# EasyEDA Pro project car.epro, board PCB1
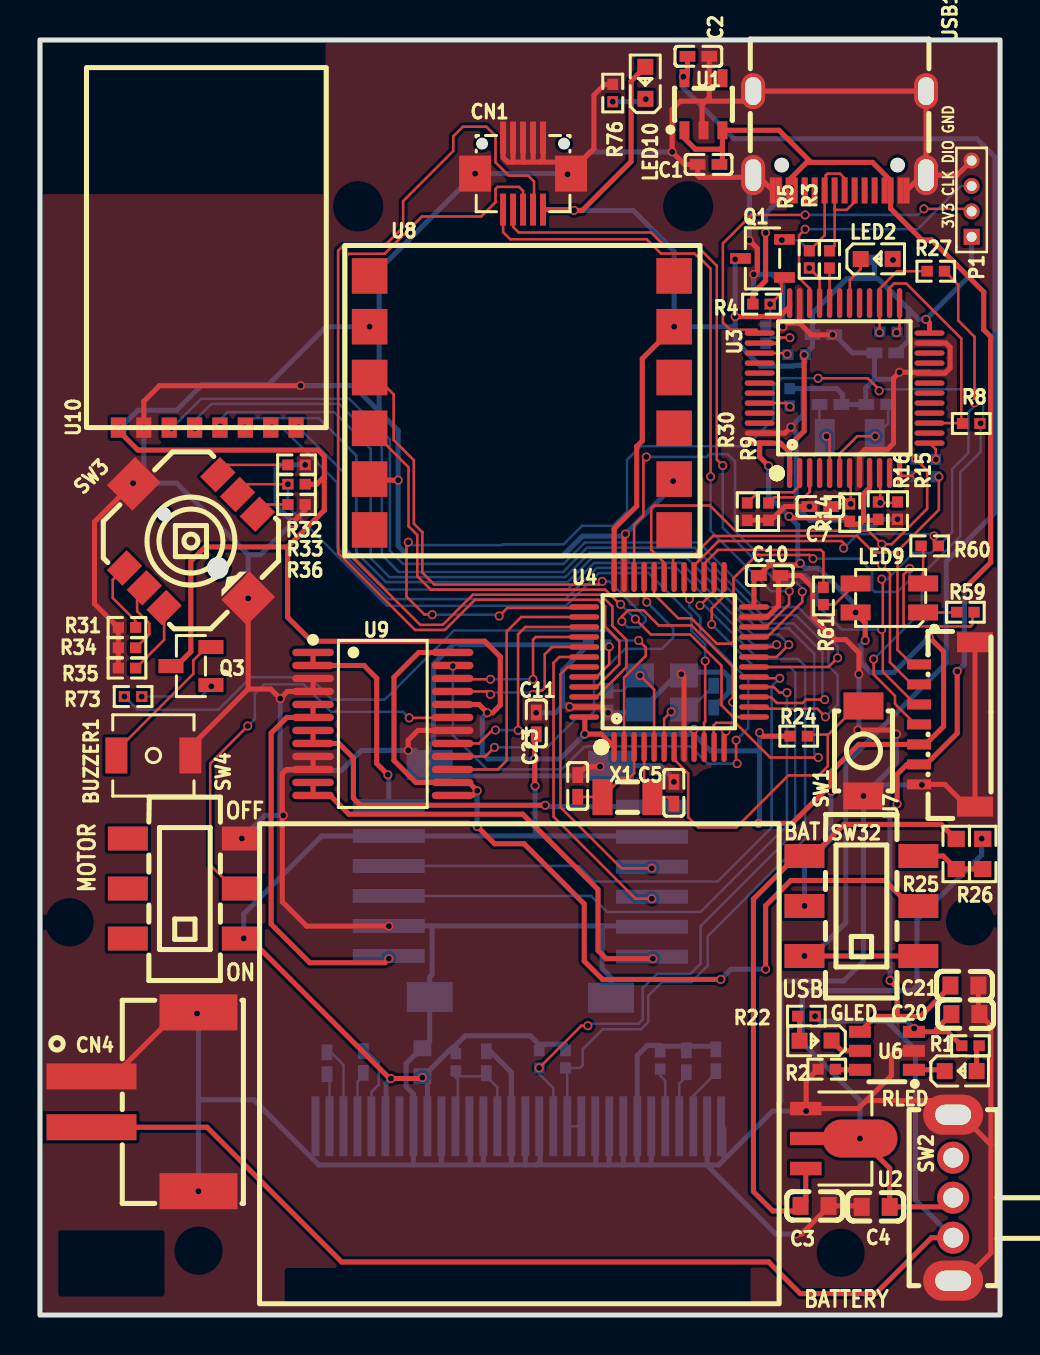
[diagram p1: board, top side]
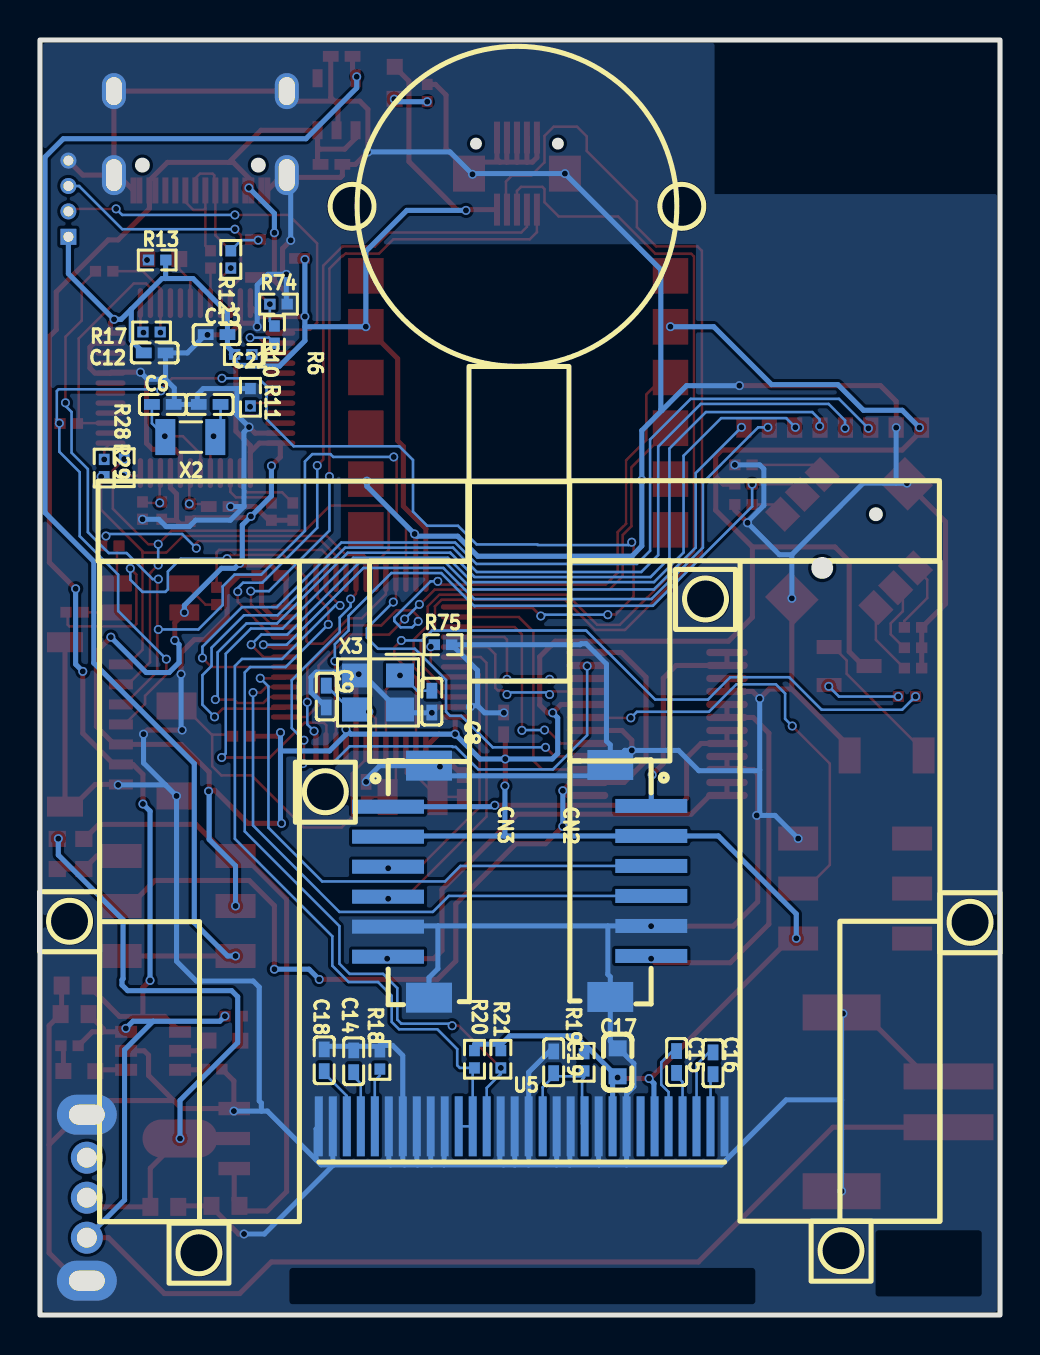
[diagram p2: board, bottom side, seen from below]

Outline 48.04 x 63.75 mm; copper layers: Top Layer, Bottom Layer. Coordinates in mm from the lower left corner of the outline.
Outline path: rectangle 0,63.75 48.04,0
Stack: Top Layer 0.035mm / Dielectric1 1.51mm FR4 er 4.5 / Bottom Layer 0.035mm

## Design rules (mm)
spacing safeClearance (default): track to track 0.127, other pairs 0.127 to 0.127
spacing Copper_copperRegion: track to track 0.152, other pairs 0.152 to 0.3
spacing Plane_innerPlane: track to track 0.152, other pairs 0.152 to 0.3
track width trackWidth (default): min 0.127, default 0.127, max 2.54
differential pair differentialPair (default): width min 0.127, default 0.254, max 2.54; gap min 0.152, default 0.152
net GND uses copperRegion

## Placement (name value [footprint] x y rotation side)
BUZZER1  4kHz  [BUZ-SMD_2P-L4.0-W4.0-L_GSC4317YA]  5.67 27.98 0 top
C1  1uF  [C0402]  33.46 57.53 0 top
C2  1uF  [C0402]  32.95 62.93 180 top
C3  10u  [C0603]  38.76 5.46 180 top
C4  10u  [C0603]  41.82 5.41 0 top
C5  12pF  [C0402]  31.72 26.11 90 top
C6  20pF  [C0402]  41.9 45.53 180 bottom
C7  100nF  [C0402]  39.05 40.42 0 top
C8  20pF  [C0402]  28.43 30.67 90 bottom
C9  20pF  [C0402]  33.72 30.92 90 bottom
C10  100nF  [C0402]  36.52 36.98 180 top
C11  100nF  [C0402]  24.84 29.58 270 top
C12  100nF  [C0402]  42.3 48.11 0 bottom
C13  100nF  [C0402]  39.2 49.02 180 bottom
C14  4.7uf  [C0402]  32.34 12.69 270 bottom
C15  1uf  [C0402]  16.19 12.65 90 bottom
C16  1uf  [C0402]  14.36 12.58 270 bottom
C17  10uf  [C0603_1]  19.14 12.64 270 bottom
C18  2.2uf  [C0402]  33.82 12.74 270 bottom
C19  100nF  [C0402]  22.34 12.64 90 bottom
C20  10uF  [C0603]  46.31 15.05 180 top
C21  10uF  [C0603]  46.26 16.47 180 top
C22  20pF  [C0402]  39.55 45.53 0 bottom
C23  12pF  [C0402]  26.91 26.45 270 top
CN1  X0502FVS-10DS-LPSN  [CONN-SMD_10P-P0.50_X0502FVS-10DS-LPSN]  24.17 57.07 180 top
CN2  A1500WV-S-06PD01  [CONN-SMD_6P-P1.50_A1500WV-S-06PD01]  18.48 21.7 90 bottom
CN3  A1500WV-S-06PD01  [CONN-SMD_6P-P1.50_A1500WV-S-06PD01#2]  29.6 21.67 270 bottom
CN4  2.54-2A-LT  [CONN-SMD_2P-P2.54_XH2.54-2AB]  5.25 10.66 270 top
GLED  ORH-G36G  [LED0603-RD]  38.81 13.72 180 top
LED2  NCD0603Y1  [LED0603-RD]  41.87 52.8 0 top
LED9  LED-RGB-3528  [LED 3528-4PIN]  42.5 35.85 0 top
LED10  -  [LED0603-RD]  30.29 61.61 90 top
P1  -  [1.27-4P烧录孔]  46.62 55.82 90 top
Q1  S8050 J3Y  [SOT-23-3_L3.0-W1.7-P0.95-LS2.9-BR]  36.16 52.83 0 top
Q3  S8550  [SOT-23-3_L2.9-W1.3-P1.90-LS2.4-BR]  7.55 32.45 0 top
R1  1K  [R0402]  46.56 13.46 180 top
R2  1.5K  [R0402]  39.37 12.29 0 top
R3  10Ω  [R0402]  39.51 52.78 270 top
R4  10kΩ  [R0402]  36.11 50.54 180 top
R5  10Ω  [R0402]  38.49 52.78 270 top
R6  100Ω  [R0402]  36.31 49.02 270 bottom
R8  0R  [R0402]  46.6 44.57 180 top
R9  10kΩ  [R0402]  36.46 40.17 270 top
R10  4.7kΩ  [R0402]  37.87 48.03 0 bottom
R11  10kΩ  [R0402]  37.51 45.89 270 bottom
R12  1.5kΩ  [R0402]  38.49 52.78 90 bottom
R13  1kΩ  [R0402]  42.18 52.75 0 bottom
R14  100kΩ  [R0402]  40.52 40.12 270 top
R15  4.7kΩ  [R0402]  41.95 40.22 270 top
R16  4.7kΩ  [R0402]  42.91 40.22 90 top
R17  100Ω  [R0402]  42.46 49.15 180 bottom
R18  1M  [R0402]  31.03 12.73 270 bottom
R19  5.1k  [R0402]  20.81 12.64 270 bottom
R20  5.1k  [R0402]  26.3 12.79 270 bottom
R21  5.1k  [R0402]  24.98 12.79 270 bottom
R22  1K  [R0402]  38.35 14.94 0 top
R24  10kΩ  [R0402]  37.97 28.94 180 top
R25  0R  [R0603]  45.85 23.05 270 top
R26  0R  [R0603]  47.17 23.05 270 top
R27  0R  [R0402]  44.83 52.19 180 top
R28  0R  [R0402]  43.83 42.37 270 bottom
R29  0R  [R0402]  44.83 42.35 90 bottom
R30  10kΩ  [R0402]  35.39 40.17 270 top
R31  3k  [R0402]  4.35 34.38 0 top
R32  1k  [R0402]  12.84 42.51 180 top
R33  1k  [R0402]  12.84 41.54 0 top
R34  4k  [R0402]  4.35 33.36 0 top
R35  5k  [R0402]  4.35 32.35 0 top
R36  2k  [R0402]  12.84 40.52 180 top
R59  1k  [R0402]  46.31 35.14 180 top
R60  2k  [R0402]  44.52 38.45 180 top
R61  510  [R0402]  39.2 35.95 90 top
R73  1kΩ  [R0402]  4.66 30.92 180 top
R74  36kΩ  [R0402]  36.11 50.54 0 bottom
R75  NC  [R0402]  27.87 33.51 180 bottom
R76  1kΩ  [R0402]  28.66 61.1 270 top
RLED  ORH-G36G  [LED0603-RD]  46.07 12.2 0 top
SW1  -  [SW-SMD_L3.9-W2.9-P4.15-LS5.0]  41.21 28.2 90 top
SW2  SK12D07VG5  [SW-TH_SK12D07VG5-1]  45.7 5.87 90 top
SW3  K1-5202UA-01  [SW-SMD_K1-5202UA-01]  7.55 38.7 45 top
SW4  MST22D18G2  [SW-SMD_MST22D18G2]  7.25 21.32 90 top
SW32  MST22D18G2  [SW-SMD_MST22D18G2]  41.11 20.45 90 top
U1  XC6210B332MR  [SOT-25_L3.0-W1.6-P0.95-LS2.8-BL]  33.2 60.54 0 top
U2  ME6209A33PG  [SOT-89-3_L4.5-W2.5-P1.50-LS4.2-BR]  39.68 8.82 180 top
U3  STM32F103CBT6  [LQFP-48_L7.0-W7.0-P0.50-LS9.0-BL]  40.26 46.35 0 top
U4  -  [LQFP-48_L7.0-W7.0-P0.50-LS9.0-BL]  31.48 32.65 0 top
U5  SSD1306  [1.3OLED-2]  24.32 10.2 0 bottom
U6  TP4059  [SOT-23-6_L2.9-W1.6-P0.95-LS2.8-BR]  42.38 13.21 0 top
U7  WAFER-SH1.0-7PLB  [CONN-SMD_7P-P1.00_HC-1.0-7PLT]  45.39 29.53 90 top
U8  -  [JY901S]  16.5 51.95 0 top
U9  TB6612FNG(O,C,8,EL  [SSOP-24_L8.4-W5.8-P0.65-LS7.8-BL]  17.16 29.55 270 top
U10  -  [nrf24f01贴片模块]  3.93 44.37 90 top
USB1  -  [USB-C_SMD-TYPE-C-31-M-12]  40.02 58.71 180 top
X1  32.768kHz  [FC-135R_L3.2-W1.5]  29.4 25.89 0 top
X2  8MHz  [CRYSTAL-SMD_L3.2-W1.5-FC-135R32.7680KF-A3]  40.52 43.9 180 bottom
X3  8MHz  [CRYSTAL-SMD_4P-L3.2-W2.5-BL]  31.13 31.13 0 bottom

## Footprints (pads in the part's own frame, mm; a bottom-side part is the same pattern mirrored in y, then rotated)
1.3OLED-2
  rect 0.4x3 smd: 1(-10.531,0.762) 2(-9.831,0.763) 3(-9.131,0.762) 4(-8.431,0.762) 5(-7.731,0.762) 6(-7.031,0.762) 7(-6.331,0.762) 8(-5.631,0.762) 9(-4.931,0.762) 10(-4.231,0.762) 11(-3.531,0.762) 12(-2.831,0.762) 13(-2.131,0.762) 14(-1.431,0.762) 15(-0.731,0.762) 16(-0.031,0.762) 17(0.669,0.762) 18(1.369,0.762) 19(2.069,0.763) 20(2.769,0.762) 21(3.469,0.761) 22(4.169,0.762) 23(4.869,0.762) 24(5.569,0.762) 25(6.269,0.763) 26(6.969,0.762) 27(7.669,0.763) 28(8.369,0.762) 29(9.069,0.762) 30(9.769,0.762)
1.27-4P烧录孔
  rect 0.8x0.8 hole 0.5: 1(-1.905,0)
  round 0.8 hole 0.5: 2(-0.635,0) 3(0.635,0) 4(1.905,0)
BUZ-SMD_2P-L4.0-W4.0-L_GSC4317YA
  rect 1.1x1.8 smd: 1(-1.85,0) 2(1.85,0)
C0402
  rect 0.79x0.54 smd: 1(-0.545,0) 2(0.545,0)
C0603
  rect 0.8x0.9 smd: 1(-0.7,0) 2(0.7,0)
C0603_1
  rect 0.8x0.9 smd: 1(-0.7,0) 2(0.7,0)
CONN-SMD_2P-P2.54_XH2.54-2AB
  rect 1.3x4.5 smd: 1(-1.27,-2.675) 2(1.27,-2.675)
  rect 1.8x3.9 smd: 3(-4.47,2.675) 4(4.47,2.675)
CONN-SMD_6P-P1.50_A1500WV-S-06PD01
  rect 0.7x3.6 smd: 1(3.75,-1.025) 2(2.25,-1.025) 3(0.75,-1.025) 4(-0.75,-1.025) 5(-2.25,-1.025) 6(-3.75,-1.025)
  rect 1.5x2.3 smd: 7(-5.8,1.025) 8(5.8,1.025)
CONN-SMD_6P-P1.50_A1500WV-S-06PD01#2
  rect 0.7x3.6 smd: 1(-3.75,-1.025) 2(-2.25,-1.025) 3(-0.75,-1.025) 4(0.75,-1.025) 5(2.25,-1.025) 6(3.75,-1.025)
  rect 1.5x2.3 smd: 7(5.8,1.025) 8(-5.8,1.025)
CONN-SMD_7P-P1.00_HC-1.0-7PLT
  rect 0.5x1.2 smd: 1(-3,1.4) 2(-2,1.4) 3(-1,1.4) 4(0,1.4) 5(1,1.4) 6(2.001,1.4) 7(3.001,1.4)
  rect 1x1.8 smd: 8(4.111,-1.4) 9(-4.111,-1.4)
CONN-SMD_10P-P0.50_X0502FVS-10DS-LPSN
  rect 0.3x1.6 smd: 1(-1,-1.8) 2(-1,1.8) 3(-0.5,-1.8) 4(-0.5,1.8) 5(0,-1.8) 6(0,1.8) 7(0.5,-1.8) 8(0.5,1.8) 9(1,-1.8) 10(1,1.8)
  rect 1.6x1.8 smd: 11(-2.4,0) 12(2.4,0)
CRYSTAL-SMD_4P-L3.2-W2.5-BL
  rect 1.4x1.2 smd: 1(-1.1,-0.85) 2(1.1,-0.85) 3(1.1,0.85) 4(-1.1,0.85)
CRYSTAL-SMD_L3.2-W1.5-FC-135R32.7680KF-A3
  rect 1x1.8 smd: 1(-1.25,0) 2(1.25,0)
FC-135R_L3.2-W1.5
  rect 1.001x1.801 smd: 1(-1.25,0) 2(1.25,0)
JY901S
  rect 1.778x1.778 smd: 1(0,0) 2(0,-2.54) 3(0,-5.08) 4(0,-7.62) 5(0,-10.16) 6(0,-12.7) 7(15.24,-12.7) 8(15.24,-10.16) 9(15.24,-7.62) 10(15.24,-5.08) 11(15.24,-2.54) 12(15.24,0)
LED0603-RD
  rect 0.8x0.8 smd: 1(-0.799,-0.004) 2(0.799,0.004)
LED 3528-4PIN
  custom 1.5x0.8 smd: 1(1.689,-0.725) 2(-1.689,-0.725) 3(-1.689,0.725) 4(1.689,0.725)
LQFP-48_L7.0-W7.0-P0.50-LS9.0-BL
  oval 0.269x1.501 smd: 1(-2.751,-4.25) 2(-2.251,-4.25) 3(-1.75,-4.25) 4(-1.25,-4.25) 5(-0.75,-4.25) 6(-0.249,-4.25) 7(0.249,-4.25) 8(0.75,-4.25) 9(1.25,-4.25) 10(1.75,-4.25) 11(2.251,-4.25) 12(2.751,-4.25) 25(2.751,4.25) 26(2.251,4.25) 27(1.75,4.25) 28(1.25,4.25) 29(0.75,4.25) 30(0.249,4.25) 31(-0.249,4.25) 32(-0.75,4.25) 33(-1.25,4.25) 34(-1.75,4.25) 35(-2.251,4.25) 36(-2.751,4.25)
  oval 1.501x0.269 smd: 13(4.25,-2.751) 14(4.25,-2.251) 15(4.25,-1.75) 16(4.25,-1.25) 17(4.25,-0.75) 18(4.25,-0.249) 19(4.25,0.249) 20(4.25,0.75) 21(4.25,1.25) 22(4.25,1.75) 23(4.25,2.251) 24(4.25,2.751) 37(-4.25,2.751) 38(-4.25,2.251) 39(-4.25,1.75) 40(-4.25,1.25) 41(-4.25,0.75) 42(-4.25,0.249) 43(-4.25,-0.249) 44(-4.25,-0.75) 45(-4.25,-1.25) 46(-4.25,-1.75) 47(-4.25,-2.251) 48(-4.25,-2.751)
nrf24f01贴片模块
  rect 1.016x0.762 smd: 1(0,0) 2(0,-1.27) 3(0,-2.54) 4(0,-3.81) 5(0,-5.08) 6(0,-6.35) 7(0,-7.62) 8(0,-8.89)
R0402
  rect 0.566x0.54 smd: 1(-0.433,0) 2(0.433,0)
R0603
  rect 0.806x0.864 smd: 1(-0.753,0) 2(0.753,0)
SOT-23-3_L2.9-W1.3-P1.90-LS2.4-BR
  rect 1.25x0.7 smd: 1(1,-0.95) 2(1,0.95) 3(-1,0)
SOT-23-3_L3.0-W1.7-P0.95-LS2.9-BR
  rect 1.038x0.532 smd: 1(1.101,-0.95) 2(1.101,0.95) 3(-1.101,0)
SOT-23-6_L2.9-W1.6-P0.95-LS2.8-BR
  rect 1.1x0.6 smd: 1(1.35,-0.95) 2(1.35,0) 3(1.35,0.95) 4(-1.35,0.95) 5(-1.35,0) 6(-1.35,-0.95)
SOT-25_L3.0-W1.6-P0.95-LS2.8-BL
  rect 0.5x0.899 smd: 1(-0.95,-1.3) 2(0,-1.3) 3(0.95,-1.3) 4(0.95,1.3) 5(-0.95,1.3)
SOT-89-3_L4.5-W2.5-P1.50-LS4.2-BR
  rect 1.575x0.672 smd: 1(1.356,-1.5) 3(1.356,1.5)
  custom 5.377x1.9 smd: 2(-1.356,0)
SSOP-24_L8.4-W5.8-P0.65-LS7.8-BL
  oval 0.364x2.082 smd: 1(-3.575,-3.491) 2(-2.925,-3.491) 3(-2.275,-3.491) 4(-1.625,-3.491) 5(-0.975,-3.491) 6(-0.325,-3.491) 7(0.325,-3.491) 8(0.975,-3.491) 9(1.625,-3.491) 10(2.275,-3.491) 11(2.925,-3.491) 12(3.575,-3.491) 13(3.575,3.491) 14(2.925,3.491) 15(2.275,3.491) 16(1.625,3.491) 17(0.975,3.491) 18(0.325,3.491) 19(-0.325,3.491) 20(-0.975,3.491) 21(-1.625,3.491) 22(-2.275,3.491) 23(-2.925,3.491) 24(-3.575,3.491)
SW-SMD_K1-5202UA-01
  rect 1.4x1.1 smd: 1(-3.3,1.4) 2(-3.3,0) 3(-3.3,-1.4) 4(3.3,1.4) 5(3.3,0) 6(3.3,-1.4)
  rect 2x1.8 smd: 7(0,4.05) 8(0,-4.05)
SW-SMD_L3.9-W2.9-P4.15-LS5.0
  rect 1.351x1.999 smd: 1(-2.251,0) 2(2.251,0)
SW-SMD_MST22D18G2
  rect 1.2x2 smd: 1(-2.5,2.85) 2(0,2.85) 3(2.5,2.85) 4(-2.5,-2.85) 5(0,-2.85) 6(2.5,-2.85)
SW-TH_SK12D07VG5-1
  oval 1.6x1.6 hole 1: 1(-2,0) 2(0,0) 3(2,0)
  oval 2x3 hole 1x1.8: 4(4.15,0) 5(-4.15,0)
USB-C_SMD-TYPE-C-31-M-12
  oval 1.2x2 hole 0.8x1.6: 0(-4.325,1.716) 0(4.325,1.716)
  oval 1.2x1.8 hole 0.8x1.4: 0(-4.325,-2.484) 0(4.325,-2.484)
  rect 0.3x1.3 smd: A1(-3.35,2.484) A4(-2.55,2.484) A5(-1.25,2.484) A6(-0.25,2.484) A7(0.25,2.484) A8(1.25,2.484) A9(2.55,2.484) A12(3.35,2.484) B1(3.05,2.484) B4(2.25,2.484) B5(1.75,2.484) B6(0.75,2.484) B7(-0.75,2.484) B8(-1.75,2.484) B9(-2.25,2.484) B12(-3.05,2.484)

## Nets
As in the schematic, except:
GND: BUZZER1.2 C1.1 C2.1 C3.1 C4.1 C5.2 C6.2 C7.1 C8.1 C9.1 C10.1 C11.1 C12.1 C13.1 C14.1 C17.1 C18.1 C19.2 C20.1 C21.1 C22.2 C23.1 CN1.1 CN1.3 CN1.5 CN1.7 CN1.9 CN1.11 CN1.12 CN2.5 CN2.7 CN2.8 CN3.5 CN3.7 CN3.8 CN4.1 CN4.3 CN4.4 P1.4 R2.1 R9.2 R11.1 R16.1 R18.1 R30.2 R31.1 R32.1 R34.1 R35.1 R36.1 R74.1 R75.2 R76.1 SW1.1 SW2.4 SW2.5 SW3.7 SW3.8 SW4.6 U1.2 U2.1 U3.8 U3.20 U3.23 U3.35 U3.47 U4.8 U4.23 U4.35 U4.47 U5.1 U5.8 U5.10 U5.12 U5.13 U5.15 U5.16 U5.17 U5.21 U5.22 U5.23 U5.24 U5.25 U5.29 U5.30 U6.2 U7.1 U7.8 U7.9 U8.5 U8.8 U9.3 U9.4 U9.9 U9.10 U9.18 U10.2 USB1.0 USB1.A1 USB1.A12 USB1.B1 USB1.B12 X3.2 X3.4

Pads without a net: SW2 3; SW4 1 2 3; U1 4; U3 4 11 14 16 17 18 19 21 22 28 29 31 40 41 42 43 45 46; U5 7; U8 1 6 7 9 10 12; USB1 A5 A8 B5 B8

## Via types
v1: diameter 0.45, hole 0.3, Top Layer to Bottom Layer, 178 vias

## Routing (per net, layer and track width the routed paths; a pad name or vN(x,y) marks a point on that pad's centre or on a via; arc(x,y) is an arc through that point)
3V3: length 270.9
  Top Layer w0.254: 41.21,39.73 41.21,41.06 41.51,41.36 U3.9 ; 41.21,39.73 41.89,39.73 41.95,39.79 ; 41.21,39.73 41.03,39.55 40.66,39.55 R14.2 40.34,39.86 37.55,39.86 v1(37.48,39.93) ; U4.48 27.26,29.87 v1(27.26,29.04) 28.09,29.04 U4.1 ; v1(35.95,24.58) 37.64,24.58 39.3,26.24 39.55,26.24 39.58,26.21 ; v1(44.5,33.89) 45.22,33.17 45.22,29.43 44.35,28.56 43.89,28.53 40.96,28.53 39.58,27.14 39.58,26.21 ; U4.36 28.73,39.32 29.86,40.45 29.86,43.43 30.14,43.71 30.14,47.82 v1(31.73,49.41) ; 14.23,41.92 14.23,40.24 12.39,38.4 ; 14.23,41.92 14.23,42.94 13.92,43.25 4.9,43.25 4.03,44.12 v1(4.03,44.37) U10.1 ; 14.23,41.92 13.85,41.54 R33.2 ; U4.9 v1(32.73,29.28) ; v1(36.46,42.46) 36.01,42.9 U3.48 37.06,43.59 37.51,43.14 ; U3.36 37.51,50.43 37.01,49.92 v1(34.78,49.92) ; v1(38.24,48) 38.24,44.19 37.51,43.47 37.51,43.14 ; v1(41.29,33.73) 41.29,34.62 40.85,35.06 ; C11.2 24.76,28.96 v1(24.76,27.8) 24.76,26.47 v1(24.78,26.45) ; U3.24 44.51,49.6 v1(44.34,49.78) ; 12.39,38.4 12.39,34.88 13.59,33.69 22.26,33.69 23.04,32.91 23.04,30.5 22.65,30.11 v1(22.39,30.11) 21.97,30.53 U9.20 ; 12.39,38.4 8.26,38.4 7.55,37.69 7.55,33.17 6.83,32.45 Q3.3 ; 34.8,52.83 34.78,52.81 v1(34.78,52.78) ; CN1.2 26.69,55.27 v1(26.72,55.23) 27.14,55.23 29.58,57.67 29.58,61.7 LED10.2 ; 39.58,26.21 v1(39.6,26.19) ; R24.2 36.19,28.94 v1(36.01,29.12) ; 37.51,43.14 U3.1 ; 35.73,35.4 35.73,36.73 C10.2 36.5,37.5 37.96,37.5 v1(38.05,37.59) ; SW4.4 10.5,18.82 17.5,11.82 v1(17.56,11.82) 19.09,11.82 v1(19.14,11.87)
  Bottom Layer w0.254: 34.78,49.41 v1(34.78,49.92) v1(34.78,52.78) ; 34.78,49.41 v1(31.73,49.41) 31.73,53.18 29.68,55.23 v1(26.72,55.23) ; 34.78,49.41 34.78,48.72 36.06,47.45 37.72,47.45 37.75,47.48 38.11,47.48 38.29,47.66 38.29,47.85 38.47,48.03 ; 41.75,51.82 41.94,51.82 43.47,50.29 ; 41.75,51.82 40.38,51.82 38.66,50.1 C13.2 38.66,48.42 38.37,48.13 ; 41.75,51.82 41.75,52.74 R13.1 ; 26.3,13.54 24.95,13.54 24.53,13.96 21.27,13.96 20.81,13.5 20.81,13.39 20.64,13.39 19.19,11.94 C17.2 v1(19.14,11.87) 19.39,11.62 U5.9 ; 24.79,23.95 24.78,23.96 v1(24.78,26.45) ; 24.79,23.95 CN2.2 14.1,23.95 10.2,20.05 v1(10.2,18.83) ; 24.79,23.95 30.59,23.95 CN3.2 ; v1(39.6,26.19) 39.58,26.16 39.58,23.78 38.26,22.46 v1(38.26,20.45) ; v1(16.5,49.41) 14.33,49.41 11.43,46.52 8.12,46.52 6.83,45.24 4.9,45.24 v1(4.03,44.37) ; v1(22.39,30.11) 22.13,29.86 22.13,28.08 22.41,27.8 v1(24.76,27.8) 26.02,27.8 v1(27.26,29.04) 32.49,29.04 v1(32.73,29.28) 32.73,29.03 33.56,28.2 35.97,28.2 36.01,28.17 ; U5.6 17.32,9.47 17.32,11.58 v1(17.56,11.82) ; P1.1 46.62,52.07 v1(44.34,49.78) 43.98,49.78 43.47,50.29 ; v1(35.95,24.58) 36.01,24.63 36.01,28.17 ; 36.01,28.17 v1(36.01,29.12) ; 43.47,50.29 43.47,48.73 C12.2 ; v1(44.5,33.89) 42.73,32.12 41.58,32.12 41.08,32.62 41.08,33.52 v1(41.29,33.73) ; v1(36.46,42.46) 36.46,40.96 v1(37.48,39.93) 37.92,39.5 37.92,37.72 v1(38.05,37.59) 38.3,37.34 38.96,37.34 40.82,35.48 v1(40.82,35.13)
GND: length 505.3
  Top Layer w0.254: 47.59,8.51 46.08,10.02 SW2.4 44.99,10.72 41.35,10.72 ; 47.59,8.51 47.59,3.1 46.2,1.72 SW2.5 ; 47.59,8.51 47.59,14.47 C20.1 46.96,15.1 C21.1 ; 33.31,60.69 33.49,60.87 C2.1 ; 33.31,60.69 35.19,60.69 USB1.0 USB1.0 USB1.0 ; 33.31,60.69 33.13,60.51 33.13,59.31 U1.2 ; 33.31,60.69 32.04,60.69 31.63,60.29 v1(31.63,58.15) 32.26,57.53 C1.1 32.91,56.98 33,56.88 35.58,56.88 USB1.0 35.9,57 36.67,56.23 ; 24.18,57.64 23.66,57.64 ; 24.18,57.64 24.68,57.64 ; 24.18,57.64 24.17,57.65 CN1.5 ; 23.66,57.64 23.4,57.64 23.17,57.87 CN1.9 ; 23.66,57.64 23.67,57.66 CN1.7 ; U3.8 41.01,43.01 41.29,43.28 42.41,43.28 42.71,43.58 42.71,46.84 v1(43.01,47.14) 44.47,47.14 U3.20 45.29,47.09 45.54,47.35 45.54,48.39 45.34,48.6 U3.23 ; U9.18 18.91,29.23 18.43,28.74 v1(18.43,28.23) ; 41.35,10.72 40.95,10.32 38.34,10.32 ; 41.35,10.72 42.61,11.98 42.61,12.99 42.82,13.21 U6.2 ; v1(40.98,32.04) 40.98,33.11 40.32,33.77 39.81,33.77 38.68,34.9 38.68,36.38 38.08,36.98 37.06,36.98 36.95,36.87 36.95,35.46 36.4,34.9 U4.23 ; v1(17.46,19.44) 13.35,19.44 12.13,20.66 12.13,27.06 12.34,27.28 U9.10 U9.9 ; 25.03,57.64 25.17,57.79 CN1.1 ; 25.03,57.64 26,57.64 CN1.11 ; 25.03,57.64 24.68,57.64 ; SW3.7 v1(4.66,41.59) 2.73,39.66 2.73,35.56 3.91,34.38 R31.1 R34.1 R35.1 ; C11.1 24.83,30.11 v1(24.83,30.11) ; R30.2 R9.2 36.59,39.74 37.27,40.42 v1(38.51,40.42) ; C23.1 27.33,27.42 v1(28.03,27.42) ; 44.1,26.53 U7.1 ; 44.1,26.53 v1(44.13,26.5) ; 44.1,26.53 45.28,26.53 46.39,25.42 U7.9 U7.8 ; CN4.1 3.68,11.93 6.88,15.13 7.91,15.13 ; C4.1 41.07,5.46 C3.1 39.46,5.41 38.1,4.05 v1(37.83,4.05) ; v1(39.66,49.01) 38.59,49.01 38.01,49.59 ; v1(42.86,29.04) 42.66,29.25 v1(40.93,29.25) ; U3.35 38.01,49.59 ; 38.01,49.59 37.35,49.59 v1(37.17,49.41) ; 7.53,27.98 7.53,28.4 10.42,31.3 ; 7.91,15.13 7.93,15.13 ; 7.91,15.13 v1(7.86,15.07) ; v1(31.68,41.69) 31.73,41.74 31.73,41.79 ; USB1.0 44.13,57 43.37,56.23 ; USB1.0 45.89,57 P1.4 ; CN1.11 26.57,57.17 27.72,58.32 27.72,61 28.26,61.53 R76.1 ; CN1.11 26.54,57.03 v1(26.4,57.03) ; v1(28.43,30.11) 28.14,30.4 U4.47 26.52,30.4 v1(26.51,30.41) ; v1(32.09,32.04) 32.23,31.9 U4.8 ; U4.35 29.23,38.99 v1(29.3,39.05) ; 24.68,57.64 24.68,58.86 CN1.3 ; U8.5 16.55,41.74 v1(17.93,41.74) ; v1(12.63,39.61) 13.27,40.25 R36.1 ; R2.1 38.93,12.29 38.34,11.7 38.34,10.32 ; v1(5.2,44.37) 5.2,45.69 5.98,46.47 v1(13.04,46.47) ; 10.42,31.3 v1(10.42,35.83) ; 10.42,31.3 11.55,31.3 v1(12.03,30.82) 12.38,31.18 U9.4 U9.3 ; v1(35.71,52.03) 35.9,52.22 35.9,53.33 v1(35.49,53.73) ; 38.34,10.32 U2.1 ; v1(37.58,44.4) 37.28,44.09 U3.47
  Bottom Layer w0.254: 34.22,7.76 34.22,9.3 U5.30 ; 34.22,7.76 36.66,10.2 36.96,10.2 ; 34.22,7.76 33.97,7.5 33.36,7.5 ; 29.81,7.5 29.89,7.59 U5.24 29.89,12.97 30.4,13.48 31.03,13.48 31.08,13.44 33.82,13.44 ; 29.81,7.5 29.15,7.5 ; 29.81,7.5 30.52,7.5 ; v1(35.49,53.73) 35.49,56.8 USB1.0 ; v1(38.51,40.42) 37.83,40.42 ; 37.83,40.42 37.83,44.14 v1(37.58,44.4) 38.19,45.01 38.19,46.32 ; 37.83,40.42 38.52,39.74 40.25,39.74 40.57,39.43 41.73,39.43 42.09,39.79 v1(42.91,39.79) ; 24.28,7.5 24.29,7.51 U5.16 ; 24.28,7.5 24.85,7.5 ; 24.28,7.5 23.6,7.5 ; 29.15,7.5 28.44,7.5 ; 29.15,7.5 29.19,7.55 U5.23 ; v1(10.1,23.82) 11.26,24.98 v1(12.18,24.98) 12.03,25.13 12.03,27.24 ; 36.96,10.2 v1(38.34,10.2) ; 36.96,10.2 36.96,10.6 37.07,10.71 37.07,16.39 37.37,16.7 40.22,16.7 41.21,17.69 v1(41.21,25.95) 41.76,26.5 ; 19.63,19.45 CN2.5 17.46,19.44 ; 19.63,19.45 28.13,19.45 ; 19.63,19.45 19.63,17.03 19.5,16.91 CN2.7 19.5,13.7 C17.1 19.09,13.34 18.32,12.57 18.32,11.42 18.69,11.05 U5.8 18.69,7.5 ; 30.52,7.5 33.36,7.5 ; 30.52,7.5 30.59,7.58 U5.25 ; 28.53,27.42 CN3.8 31.04,27.47 31.72,26.78 v1(31.72,26.66) ; 28.53,27.42 28.07,26.96 20.04,26.96 CN2.8 ; 28.53,27.42 v1(28.03,27.42) ; 24.85,7.5 27.82,7.5 ; 24.85,7.5 25.03,7.68 25.03,9.39 U5.17 ; 27.82,7.5 27.82,9.41 U5.21 ; 27.82,7.5 28.44,7.5 ; 12.03,27.24 v1(12.03,30.82) ; 12.03,27.24 12.05,27.22 15.07,27.22 16.09,28.23 v1(18.43,28.23) 18.77,28.23 CN2.8 ; 18.69,7.5 20.07,7.5 ; 18.69,7.5 13.95,7.5 10.7,10.76 7.93,10.76 ; 20.07,7.5 21.53,7.5 ; 20.07,7.5 20.09,7.52 U5.10 ; CN3.7 28.57,16.87 28.13,17.31 28.13,19.45 ; 27.43,33.51 26.15,32.23 26.15,30.47 ; 27.43,33.51 21.02,33.51 20.97,33.57 20.71,33.57 19.7,32.55 19.7,28.7 19.5,28.51 CN2.8 ; 27.43,33.51 R75.2 ; v1(31.63,58.15) 27.52,58.15 v1(26.4,57.03) 26.37,57.07 v1(21.77,57.07) 16.97,52.27 16.97,45.29 16.92,45.23 ; 41.76,26.5 v1(44.13,26.5) ; 41.76,26.5 42.86,27.61 v1(42.86,29.04) ; 33.36,7.5 36.81,4.05 v1(37.83,4.05) ; 33.36,7.5 33.39,7.53 U5.29 ; 28.13,19.45 30.59,19.45 CN3.5 ; 38.19,46.32 39.87,46.32 40.17,46.02 40.17,45.6 C22.2 C6.2 41.32,45.56 41.32,46.35 41.76,46.79 ; 38.19,46.32 R11.1 ; v1(26.51,30.41) 26.45,30.47 26.15,30.47 ; 41.76,46.79 C12.1 40.66,48.11 C13.1 ; 41.76,46.79 42.66,46.79 v1(43.01,47.14) ; X3.2 32.16,32.04 v1(32.09,32.04) ; X3.2 31.83,31.98 30.13,30.28 X3.4 29.86,30.11 v1(28.43,30.11) C8.1 ; X3.2 32.39,32.14 34.22,32.14 34.48,31.89 34.48,31.14 C9.1 ; U5.12 21.53,9.39 21.53,7.5 ; 28.44,7.5 28.49,7.56 U5.22 ; 16.92,45.23 15.68,46.47 v1(13.04,46.47) ; 16.92,45.23 17.93,44.22 v1(17.93,41.74) 17.93,38.45 18.42,37.94 26.14,37.94 27.14,38.94 29.18,38.94 v1(29.3,39.05) 31.68,41.44 v1(31.68,41.69) ; 10.42,38.02 6.84,41.59 5.2,41.59 ; 10.42,38.02 11.04,38.02 v1(12.63,39.61) 12.63,39.66 11.82,40.47 11.82,42.3 12.03,42.51 v1(13.27,42.51) ; 10.42,38.02 v1(10.42,35.83) ; v1(37.17,49.41) 37.17,51.5 36.64,52.03 v1(35.71,52.03) 35.71,50.59 R74.1 ; v1(40.98,32.04) 40.98,29.3 v1(40.93,29.25) ; v1(7.86,15.07) 7.93,15.01 7.93,10.76 ; U5.13 22.19,7.5 ; 22.19,7.5 21.53,7.5 ; 22.19,7.5 23.6,7.5 ; 23.6,7.5 23.59,7.52 U5.15 23.59,12.14 22.39,13.34 22.34,13.34 ; v1(7.93,6.19) 7.93,10.76 ; 5.2,41.59 v1(4.66,41.59) ; 5.2,41.59 v1(5.2,44.37) ; v1(24.83,30.11) 25.79,30.11 26.15,30.47
VBAT: length 69
  Top Layer w0.254: R1.2 46.12,13.46 45.42,14.16 44.88,14.16 ; C20.2 44.88,14.32 44.88,14.16 ; 44.88,14.16 U6.3 ; CN4.2 8.36,9.39 15.1,2.65 36.47,2.65 38.05,1.07 41.82,1.07 44.61,3.87 SW2.1
  Bottom Layer w0.254: 42.38,14.69 43.39,14.69 v1(43.74,14.33) ; 42.38,14.69 39.04,14.69 v1(38.78,14.94) ; 42.38,14.69 43.81,13.26 43.81,5.75 SW2.1
VCC_MOTOR: length 46.9
  Top Layer w0.254: v1(34.07,16.78) 28.15,16.78 27.23,17.7 27.23,20.55 24.22,23.56 22.75,23.56 v1(21.88,24.43) ; SW32.5 43.56,20.45 42.28,21.73 37.57,21.73 36.31,20.47 v1(36.31,17.29) ; U9.24 18.95,33.13 17.71,31.89 17.71,27.72 18.81,26.63 U9.14 21.47,26.63 v1(21.88,26.21) 21.64,25.98 U9.13
  Bottom Layer w0.254: v1(34.07,16.78) 34.58,17.29 v1(36.31,17.29) ; v1(21.88,24.43) v1(21.88,26.21)
ADC_KEY: length 34.5
  Top Layer w0.127: v1(12.41,41.54) 10.4,41.54 SW3.5 ; 33.23,28.4 33.23,29.61 33.29,29.67 v1(33.29,32.7)
  Bottom Layer w0.127: 26.3,35.43 27.96,37.1 30.46,37.1 32.6,34.96 32.6,34.23 33.29,33.54 v1(33.29,32.7) ; 26.3,35.46 17.37,35.46 12.41,40.43 v1(12.41,41.54)
BAT_3.3V: length 31.5
  Top Layer w0.254: U2.3 38.32,5.72 C3.2 37.81,5.2 36.67,5.2 35.7,6.17 35.7,20.8 37.86,22.95 SW32.3 38.66,22.95 40.24,24.53 45.09,24.53 45.82,23.81 R25.1
BAT_3.7V: length 30.5
  Top Layer w0.254: SW2.2 45.24,5.41 C4.2 42.52,7.34 v1(41.03,8.82) ; v1(47.12,23.82) 47.16,23.82 R26.1
  Bottom Layer w0.254: v1(41.03,8.82) 41.03,10.73 38.15,13.62 38.15,15.91 38.45,16.22 43.66,16.22 43.94,16.5 43.94,16.75 43.88,16.81 43.88,19.76 47.12,23 v1(47.12,23.82)
BOOT0: length 2.4
  Top Layer w0.127: U4.44 27.85,31.9 28.48,32.54 v1(28.48,33.41)
BUZZER: length 34.7
  Top Layer w0.127: U4.2 29.23,31.87 30.31,32.96 30.31,33.37 v1(29.96,33.73)
  Bottom Layer w0.127: v1(4.23,30.92) 4.24,30.92 4.9,30.26 8.93,30.26 10.55,31.89 13.5,31.89 14.62,30.77 17.26,30.77 20.71,34.23 28.42,34.23 28.92,33.73 v1(29.96,33.73)
CODER_A1: length 30.5
  Top Layer w0.127: U4.16 36.72,31.4 37,31.12 v1(37.38,31.12)
  Bottom Layer w0.127: CN2.4 27.58,20.95 28.38,20.15 33.06,20.15 37.38,24.48 v1(37.38,31.12)
CODER_A2: length 29.5
  Top Layer w0.127: U4.17 35.79,31.84 v1(37.02,31.84)
  Bottom Layer w0.127: v1(37.02,31.84) 36.61,31.43 36.61,24.37 33.92,21.68 27.77,21.68 27,22.45 CN2.3
CODER_B1: length 16.1
  Top Layer w0.127: v1(30.62,20.81) 29.81,20.81 25.7,24.92 25.7,32.61 25.99,32.9 U4.42
  Bottom Layer w0.127: v1(30.62,20.81) 30.62,20.91 CN3.4
CODER_B2: length 13.9
  Top Layer w0.127: U4.43 26.41,32.4 26.05,32.04 26.05,25.39 29.09,22.34 v1(30.62,22.34)
  Bottom Layer w0.127: v1(30.62,22.34) 30.62,22.41 CN3.3
D+: length 5.8
  Top Layer w0.127: R5.1 39.27,53.98 39.27,56.23 39.32,56.28 39.32,56.98 39.41,57.07 40.03,57.07 40.27,56.84 40.27,56.23
D-: length 4.9
  Top Layer w0.127: R3.1 39.77,53.47 39.77,55.32 ; 39.77,55.32 39.83,55.26 40.37,55.26 40.77,55.65 40.77,56.23 ; 39.77,55.32 39.77,56.23
LED_B: length 8.7
  Top Layer w0.127: 33.23,36.9 33.23,37.56 33.93,38.26 39.08,38.26 39.2,38.13 39.2,36.39
LED_G: length 14.4
  Top Layer w0.127: U4.28 32.73,37.48 33.95,38.7 40.12,38.7 40.28,38.53 40.28,38.4 v1(40.22,38.34) ; v1(44.74,38.95) 44.74,38.67 R60.1
  Bottom Layer w0.127: v1(44.74,38.95) 44.64,39.05 40.93,39.05 v1(40.22,38.34)
LED_R: length 27.5
  Top Layer w0.127: v1(43.52,37.33) 43.22,37.02 43.22,34.56 43.34,34.43 46.57,34.43 46.66,34.52 46.66,35.06 R59.1 ; v1(38.68,37.82) 38.49,38 35.87,38 34.71,36.84 34.71,33.69 34.58,33.57 33.87,33.57 32.6,34.84 31.94,34.84 30.73,36.04 U4.32
  Bottom Layer w0.127: v1(43.52,37.33) 43.52,36.77 42.91,36.16 41.77,36.16 41.64,36.28 41.64,37.17 41,37.82 v1(38.68,37.82)
LED_STLINK: length 2.4
  Top Layer w0.127: LED2.1 41.07,52.29 40.53,51.75 40.53,50.61 40.51,50.59
MOTOR_A1: length 8.7
  Top Layer w0.127: 22.54,31.05 22.41,31.18 U9.21 ; U4.41 25.63,33.4 25.26,33.03 25.26,31.36 25.13,31.23 24.88,31.23 v1(24.67,31.03)
  Bottom Layer w0.127: v1(24.67,31.03) 24.57,31.13 22.63,31.13 22.55,31.05 22.54,31.05
  vias: v1(22.54,31.02)
MOTOR_A2: length 8.6
  Top Layer w0.127: U9.22 20.69,31.79 v1(22.54,31.79) ; U4.40 24.81,33.9 24.67,33.77 v1(24.67,31.79)
  Bottom Layer w0.127: v1(24.67,31.79) v1(22.54,31.79)
MOTOR_A_PWM: length 30.2
  Top Layer w0.127: v1(20.66,32.45) 20.66,32.46 U9.23 ; v1(34.83,28.74) 34.83,27.62 v1(34.88,27.57) ; v1(32.5,35.8) 32.23,36.07 U4.29
  Bottom Layer w0.127: v1(32.5,35.8) 32.5,35.42 33.04,34.87 33.04,34.14 35.44,31.74 35.44,29.35 v1(34.83,28.74) ; v1(20.66,32.45) 20.66,28.99 22.38,27.28 26.11,27.28 27.23,28.4 27.39,28.4 27.42,28.43 32.55,28.43 33.41,27.57 v1(34.88,27.57)
MOTOR_B1: length 11.8
  Top Layer w0.127: v1(23.93,29.23) 23.93,34.04 24.29,34.4 U4.39 ; U9.17 21.97,28.58 22.64,29.25 v1(22.79,29.25)
  Bottom Layer w0.127: v1(23.93,29.23) 23.91,29.25 v1(22.79,29.25)
MOTOR_B2: length 18.1
  Top Layer w0.127: U9.16 22.29,27.93 v1(22.74,28.38) ; U4.33 30.23,35.78 v1(30.36,35.65)
  Bottom Layer w0.127: v1(30.36,35.65) 31.68,34.33 31.68,33.87 31.13,33.31 29.28,33.31 27.72,31.75 27.72,30.16 27.52,29.96 26.96,29.96 25.38,28.38 v1(22.74,28.38)
MOTOR_B_PWM: length 13.5
  Top Layer w0.127: U4.38 24.08,34.9 23.35,34.17 23.35,27.72 22.91,27.28 U9.15
MOTOR_OUT_A1: length 10.7
  Top Layer w0.254: v1(17.41,27.01) 16.85,27.57 16.85,31.84 16.21,32.48 U9.2 U9.1
  Bottom Layer w0.254: CN2.1 17.45,26.97 v1(17.41,27.01)
MOTOR_OUT_A2: length 19.5
  Top Layer w0.254: U9.5 U9.6 12.35,29.88 11.57,29.09 11.57,19.54 13.5,17.61 17.26,17.61 v1(17.46,17.82)
  Bottom Layer w0.254: v1(17.46,17.82) 17.46,17.94 CN2.6
MOTOR_OUT_B1: length 20.1
  Top Layer w0.254: v1(25.28,25.49) 16.04,25.49 15.68,25.84 15.68,27.85 14.96,28.58 U9.8 U9.7
  Bottom Layer w0.254: CN3.1 25.35,25.42 v1(25.28,25.49)
MOTOR_OUT_B2: length 22.9
  Top Layer w0.254: v1(30.67,17.82) 28.33,17.82 27.92,18.22 27.92,21.27 24.16,25.04 15.46,25.04 14.52,25.98 U9.12 U9.11
  Bottom Layer w0.254: v1(30.67,17.82) 30.67,17.87 CN3.6
MPU6050B_RX: length 29.3
  Top Layer w0.127: v1(29.06,35.53) 29.02,35.53 28.29,36.27 19.55,36.27 18.88,36.94 18.88,39.01 ; v1(29.79,34.8) 30.57,34.02 32.55,34.02 34.1,32.47 34.1,30.49 34.69,29.9 U4.13 ; 18.44,42.38 18.44,39.44 18.87,39.01 ; U8.4 18.45,42.38
  Bottom Layer w0.127: v1(29.79,34.8) v1(29.06,35.53)
MPU6050B_TX: length 36
  Top Layer w0.127: U4.12 34.23,29.1 v1(34.33,29.2) ; 19.13,39.14 18.71,39.56 18.71,42.74 17.7,43.75 17.7,46.03 16.78,46.95 ; 19.13,39.14 19.13,37.12 19.73,36.52 27.97,36.52 v1(28.13,36.68) ; 19.13,39.14 19.14,39.13 ; v1(34.67,30.64) 34.67,32.41 32.6,34.48 30.96,34.48 30.21,35.23 29.43,35.23 29.12,34.92 v1(29.12,34.68)
  Bottom Layer w0.127: v1(34.67,30.64) 34.67,29.53 v1(34.33,29.2) ; v1(28.13,36.68) 28.5,36.68 30.31,34.87 30.31,34.7 29.99,34.38 29.42,34.38 v1(29.12,34.68)
NRF_CE: length 48.1
  Top Layer w0.127: U4.18 39.46,32.4 v1(39.91,32.85)
  Bottom Layer w0.127: v1(39.91,32.85) 39.91,33.41 37.93,35.39 36.19,35.39 32.96,38.62 27.27,38.62 26.2,37.55 18.17,37.55 17.51,38.21 17.51,43.78 15.48,45.81 8.06,45.81 v1(6.59,44.33)
NRF_CSN: length 49.4
  Top Layer w0.127: U4.14 35.82,30.31 38.9,30.31 v1(39.3,29.91)
  Bottom Layer w0.127: v1(39.3,29.91) 39.91,30.52 39.91,31.99 39.46,32.45 39.46,33.36 37.83,34.99 36.15,34.99 32.77,38.37 27.37,38.37 26.18,37.15 17.95,37.15 17.1,38 17.1,43.42 14.97,45.55 8.58,45.55 7.75,44.73 v1(7.75,44.33)
NRF_IRQ: length 34.3
  Top Layer w0.127: v1(37.47,33.51) 36.86,32.9 U4.19
  Bottom Layer w0.127: 26.38,36.28 17.32,36.28 15.23,38.37 15.23,42.1 v1(12.94,44.39) ; 26.38,36.26 27.73,37.61 32.08,37.61 35.66,34.02 36.97,34.02 v1(37.47,33.51)
NRF_MISO: length 34.1
  Top Layer w0.127: v1(36.86,33.51) 36.75,33.4 U4.20
  Bottom Layer w0.127: v1(36.86,33.51) 35.69,33.51 31.85,37.35 27.86,37.35 26.3,35.8 17.44,35.8 14.87,38.37 14.87,41.62 12.1,44.39 v1(11.62,44.39)
NRF_MOSI: length 49.8
  Top Layer w0.127: U4.11 33.71,28.42 33.71,29.48 33.84,29.61 34.8,29.61 36.54,27.88 v1(38.95,27.88)
  Bottom Layer w0.127: v1(38.95,27.88) 38.75,28.08 38.75,33.06 37.48,34.32 35.9,34.32 32.37,37.86 27.63,37.86 26.41,36.64 17.31,36.64 15.84,38.12 15.84,42.96 13.95,44.84 10.7,44.84 v1(10.24,44.39)
NRF_SCK: length 45.9
  Top Layer w0.127: U4.15 36.57,30.9 36.87,30.6 38.17,30.6 38.34,30.77 v1(39.27,30.77)
  Bottom Layer w0.127: 26.31,36.92 27.49,38.1 27.51,38.1 27.51,38.11 32.64,38.11 36.18,34.58 37.71,34.58 39.15,33.13 39.15,30.89 v1(39.27,30.77) ; v1(9.03,44.44) 9.03,44.78 9.4,45.15 14.72,45.15 16.55,43.32 16.55,37.84 17.49,36.9 26.31,36.9
NRST: length 17.3
  Top Layer w0.127: SW1.2 40.88,30.45 39.42,28.99 ; R24.1 38.48,29.02 39.42,29.02 39.42,27.44 38.96,26.98 37.45,26.98 34.84,24.38 32.95,24.38 32.44,24.89 32.44,27.08 31.73,27.79 U4.7
OLED_SCL: length 38.4
  Top Layer w0.127: v1(27.42,14.46) 27.09,14.46 v1(24.98,12.36) ; v1(33.62,34.53) 33.62,35.33 34.15,35.86 34.15,36.82 U4.25
  Bottom Layer w0.127: U5.18 25.69,11.35 25.01,12.03 24.98,12.03 ; v1(27.42,14.46) 27.52,14.57 29.96,14.57 30.16,14.77 30.16,16.34 30.87,17.06 32.55,17.06 33.06,17.56 33.06,19.44 37.79,24.18 37.79,32.13 37.53,32.4 35.75,32.4 v1(33.62,34.53)
OLED_SDA: length 39.4
  Top Layer w0.127: U4.26 33.73,36.18 v1(33.03,35.48)
  Bottom Layer w0.127: v1(33.03,35.48) 33.25,35.48 35.93,32.8 37.93,32.8 38.29,32.45 38.29,23.81 33.41,18.93 33.41,17.46 32.6,16.65 31.13,16.65 30.44,15.96 30.44,14.65 30.07,14.29 28.15,14.29 27.16,13.3 27.16,12.48 27.03,12.36 26.3,12.36 26.39,12.27 U5.19 27.09,9.43
PA9/TX: length 23.9
  Top Layer w0.127: 42.91,38.12 41.72,38.12 40.89,38.95 33.69,38.95 ; 42.91,38.12 42.91,33.26 43.64,32.53 U7.7 ; 42.91,38.12 42.91,38.19 44.98,40.26 v1(44.98,41.91) ; U4.30 31.73,37.26 ; 31.68,37.26 31.68,37.83 31.84,37.99 32.72,37.99 33.69,38.96
PA10/RX: length 29.8
  Top Layer w0.127: v1(42.13,37.5) 42.53,37.1 42.53,32.64 43.64,31.53 U7.6 ; U4.31 31.23,37.62 30.57,38.28 ; 30.59,38.29 30.59,40.34 30.72,40.47 33.53,40.47 34.79,39.21 41.45,39.21 v1(42.13,38.54) 42.62,38.54 44.4,40.31 44.4,42.23 v1(43.83,42.8)
  Bottom Layer w0.127: v1(42.13,37.5) v1(42.13,38.54)
PA13/SWD: length 50.1
  Top Layer w0.127: U7.5 43.81,30.53 42.18,32.16 42.18,36.74 v1(42.12,36.79) ; v1(46.77,45.61) 46.77,48.91 45.95,49.73 45.95,51.51 45.27,52.19 R27.1 ; v1(30.34,42.9) 30.2,42.76 30.2,39.97 29.73,39.5 U4.34
  Bottom Layer w0.127: v1(42.12,34.28) 40.12,34.28 38.9,35.5 38.9,36.43 38.31,37.02 36.97,37.02 34.78,39.2 34.78,42.67 34.41,43.04 33.51,43.04 33.37,42.9 v1(30.34,42.9) ; v1(46.77,45.61) 46.77,45.46 46.46,45.15 46.46,43.11 45.65,42.3 45.65,39.14 44.6,38.1 43.71,38.1 42.4,36.79 v1(42.12,36.79)
PA14/SWC: length 66.8
  Top Layer w0.127: 27.06,35.35 23.38,35.35 v1(22.98,34.95) ; R8.1 47.05,44.59 v1(47.07,44.59) ; v1(38.94,46.84) 41.43,46.84 42.04,46.23 ; 19.23,35.03 18.34,35.92 18.34,38.63 ; v1(41.72,32.79) 41.72,32.02 42.78,30.96 42.78,30.56 43.81,29.53 U7.4 ; v1(19.63,35.02) 19.62,35.03 19.24,35.03
  Bottom Layer w0.127: v1(38.94,46.84) 37.1,46.84 36.71,46.44 36.71,44.8 35.35,43.44 30.06,43.44 29.38,42.75 29.38,40.17 28.67,39.46 27.12,39.46 26.19,38.53 23.14,38.53 ; v1(41.72,32.79) 44.13,35.21 44.13,37.02 46.05,38.94 46.05,42.14 47.07,43.16 v1(47.07,44.59) ; 22.85,34.93 22.76,35.02 v1(19.63,35.02) ; 47.02,44.58 47.2,44.75 47.2,46.2 47.11,46.29 42.26,46.29 ; v1(18.43,38.64) 18.57,38.5 23.14,38.5
  vias: v1(41.99,46.21)
PB8: length 53.1
  Top Layer w0.127: U4.45 27.85,31.4 28.99,32.55 28.99,33.7 28.28,34.41 28.28,35.43 27.95,35.76 21.77,35.76 20.26,34.25 18.77,34.25 14.92,38.1 14.92,53.21 15.14,53.43 17.21,53.43 18.17,54.39 18.17,55.69 20.68,58.2 20.68,58.93 21.16,59.42 22.34,59.42 22.8,58.96 22.8,57.63 23.46,56.97 24.43,56.97 24.72,56.67 24.72,55.32 CN1.4
PB9: length 48.2
  Top Layer w0.127: U4.46 27.85,30.9 29.35,32.4 29.35,33.76 28.64,34.46 28.64,35.42 28.06,36.01 21.66,36.01 20.16,34.51 19.03,34.51 15.32,38.18 15.32,52.93 15.45,53.06 17.24,53.06 19.11,54.93 22.08,54.93 22.8,55.64 22.8,56.3 22.9,56.41 23.97,56.41 24.17,56.2 CN1.6
PB10: length 34.1
  Top Layer w0.127: v1(38.15,36.17) 38.15,35.66 36.39,33.9 U4.21 ; CN1.8 23.67,54.41 23.96,54.12 30.58,54.12 31.28,53.43 32.9,53.43 33.87,52.46 33.87,42.77 v1(34.17,42.47)
  Bottom Layer w0.127: v1(34.17,42.47) 34.17,39.36 36.92,36.61 37.88,36.61 38.15,36.35 v1(38.15,36.17)
PB11: length 33.4
  Top Layer w0.127: CN1.10 23.17,54.14 23.53,53.79 30.36,53.79 31.07,53.07 32.75,53.07 32.88,52.94 ; v1(37.5,36.19) 37.48,36.18 37.48,35.54 36.35,34.4 U4.22 ; 32.9,52.97 33.56,52.32 v1(33.56,41.92)
  Bottom Layer w0.127: v1(33.56,41.92) 33.56,39.22 36.59,36.19 v1(37.5,36.19)
PC14: length 4.6
  Top Layer w0.127: C23.2 28.13,25.91 X1.1 29.11,26.86 29.5,26.86 29.73,27.09 U4.3
PC15: length 3.9
  Top Layer w0.127: C5.1 31.4,25.89 X1.2 30.65,26.22 30.23,26.64 U4.4
PD0: length 5.6
  Top Layer w0.127: v1(30.03,31.98) 30.73,31.27 U4.5
  Bottom Layer w0.127: 28.64,31.21 29.16,31.21 29.93,31.98 v1(30.03,31.98)
PD1: length 4.6
  Top Layer w0.127: U4.6 31.23,29.81 v1(31.58,30.16)
  Bottom Layer w0.127: C9.2 32.61,30.36 32.31,30.36 X3.3 32.11,30.16 v1(31.58,30.16)
ST_SWCLK: length 19.2
  Top Layer w0.127: v1(38.29,55) 35.6,55 34.17,53.58 34.17,49.62 34.53,49.26 35.85,49.26 U3.37 ; v1(44.23,55.31) 46.49,55.31 P1.2
  Bottom Layer w0.127: v1(38.29,55) 43.93,55 v1(44.23,55.31)
ST_SWDIO: length 13.3
  Top Layer w0.127: v1(38.29,54.29) 37.98,53.99 37.98,51.85 38.51,51.32 U3.34
  Bottom Layer w0.127: v1(38.29,54.29) 43.93,54.29 46.09,56.45 P1.3
STLINK_EXT_RX: length 0.9
  Top Layer w0.127: U3.13 44.83,43.28 v1(44.83,42.78)
STLINK_EXT_SWC: length 11.5
  Top Layer w0.127: U3.26 42.51,51.35 42.74,51.58 43.35,51.58 46.1,48.82 46.1,44.64 46.15,44.6 ; 46.15,44.6 R8.2 ; 46.15,44.6 U3.15
STLINK_EXT_SWD: length 5
  Top Layer w0.127: R27.2 42.89,52.19 42.01,51.31 U3.27 v1(42.01,49.12)
  Bottom Layer w0.127: R17.2 42.02,49.13 v1(42.01,49.12)
STLINK_EXT_TX: length 1
  Top Layer w0.127: 43.01,42.1 43.15,41.96 v1(43.88,41.96)
  Bottom Layer w0.127: R28.2 43.85,41.93 v1(43.88,41.96)
USB_3.3V: length 68.7
  Top Layer w0.254: C2.2 32.4,61.99 U1.5 32.25,61.85 v1(32.19,61.91) ; v1(38.26,17.95) SW32.4
  Bottom Layer w0.254: v1(38.26,17.95) 38.66,17.95 40.32,19.62 40.32,27.57 45.35,32.6 45.35,37.68 47.79,40.12 47.79,57.9 46.87,58.81 34.73,58.81 32.19,61.35 v1(32.19,61.91)
USB_5V: length 75
  Top Layer w0.254: v1(42.53,16.73) 42.89,16.37 42.89,14.93 ; U6.4 41.8,14.93 42.89,14.93 ; C21.2 45.56,16.42 44.06,14.93 42.89,14.93 ; 37.47,56.23 37.47,56.73 38.37,57.63 38.59,57.63 ; 37.47,56.23 37.47,56.23 ; 37.47,56.23 v1(37.59,56.36) ; v1(45.9,32.18) 45.9,29.09 44.34,27.53 U7.2 43.39,27.53 42.89,27.03 v1(42.89,25.55) ; 34.04,58.29 34.15,58.29 34.15,57.68 34,57.53 ; 34.04,58.29 34.15,58.4 U1.3 36.98,59.24 38.59,57.63 ; 34.04,58.29 32.79,58.29 32.25,58.84 U1.1 ; v1(36.31,54.11) 36.31,51.71 35.67,51.08 R4.2 ; v1(46.26,36.31) 47.57,37.63 47.57,48.92 47.23,49.27 47.23,51.15 44.62,53.75 44.13,53.75 42.57,55.32 42.57,56.73 41.66,57.63 38.59,57.63
  Bottom Layer w0.254: v1(42.89,25.55) 42.53,25.19 v1(42.53,16.73) ; v1(36.31,54.11) 36.31,55.08 v1(37.59,56.36) ; v1(45.9,32.18) 46.26,32.54 v1(46.26,36.31)
USB_D+: length 2
  Top Layer w0.127: U3.33 39.01,51.83 v1(38.49,52.35)
USB_D-: length 1.8
  Top Layer w0.127: U3.32 39.51,50.6 R3.2
USB_RENUMN: length 3
  Top Layer w0.127: v1(37.53,48.87) 37.08,48.87 36.78,48.56 36.05,48.56 U3.38
  Bottom Layer w0.127: v1(37.53,48.87) 36.59,48.87 36.31,48.59
$1N12780: length 1.6
  Top Layer w0.127: v1(37.12,53.74) 37.11,53.76 37.11,53.78
  Bottom Layer w0.127: v1(37.12,53.74) 37.97,53.74 38.49,53.22 R12.2
$1N12782: length 2.8
  Top Layer w0.127: v1(36.54,50.54) 36.55,50.54 37.11,51.1 37.11,51.88
  Bottom Layer w0.127: R6.1 36.54,49.68 v1(36.54,50.54)
$1N12786: length 3.6
  Top Layer w0.127: R30.1 35.92,41.13 36.63,41.13 36.64,41.14 37.68,41.14 38.01,41.47 U3.2
$1N12787: length 3.2
  Top Layer w0.127: U3.3 38.51,41.16 38.24,40.88 36.74,40.88 R9.1
$1N12790: length 3.8
  Top Layer w0.127: v1(39.36,43.94) 39.51,43.78 U3.5
  Bottom Layer w0.127: 39,45.53 39,44.29 v1(39.36,43.94) 39.31,43.94 X2.2
$1N12791: length 5
  Top Layer w0.127: v1(41.8,43.94) 40.89,43.94 40.01,43.06 40.01,42.1
  Bottom Layer w0.127: 41.77,43.9 41.8,43.92 v1(41.8,43.94) 42.44,44.59 42.44,45.53
$1N12796: length 2.4
  Top Layer w0.127: R16.2 42.87,40.61 v1(42.05,40.61) 42.05,42.06 U3.10
$1N12798: length 2.4
  Top Layer w0.127: v1(40.57,40.56) 40.57,42.04 40.51,42.1 ; 39.71,40.55 R14.1
$1N12808: length 1.5
  Top Layer w0.127: v1(42.86,49.12) 43.01,49.27 43.01,50.59
$1N12820: length 1.4
  Top Layer w0.127: v1(37.39,48.04) 37.34,48.1 U3.39
$1N12821: length 1.6
  Top Layer w0.127: U3.44 37.35,45.6 v1(37.53,45.41)
  Bottom Layer w0.127: v1(37.53,45.41) 37.53,45.44 R11.2
$1N12835:
  vias: v1(42.69,52.75)
$1N26575: length 1.2
  Top Layer w0.254: U6.6 39.84,12.26 39.81,12.29
$1N26597: length 1.3
  Top Layer w0.254: R1.1 46.87,13.34 RLED.2
$1N26598: length 1.6
  Top Layer w0.254: U6.5 40.12,13.21 GLED.1
$1N26615: length 1.3
  Top Layer w0.254: GLED.2 38.01,14.85 R22.1
$1N26644: length 22.4
  Top Layer w0.127: v1(18.48,29.86) 20.63,29.86 U9.19 ; v1(10.4,29.45) 8.52,27.57 8.52,22.5 9.7,21.32 SW4.5
  Bottom Layer w0.127: v1(10.4,29.45) 10.75,29.81 10.75,31.08 11.21,31.53 13.19,31.53 14.56,30.16 18.17,30.16 v1(18.48,29.86)
$1N26655: length 3.5
  Top Layer w0.254: SW32.6 45.2,22.95 R25.2 R26.2
$1N26693: length 6.8
  Bottom Layer w0.127: U5.14 22.89,11.39 22.34,11.94 20.87,11.94 20.81,11.88 20.91,11.78 20.91,9.56 U5.11
$1N26696: length 3.1
  Bottom Layer w0.127: U5.28 32.69,10.96 33.77,12.04 33.82,12.04
$1N26699: length 2.5
  Bottom Layer w0.127: 14.36,11.88 14.49,11.76 U5.2
$1N26700: length 4.2
  Bottom Layer w0.127: 14.36,13.28 14.41,13.28 15.19,12.51 U5.3
$1N26701: length 2.6
  Bottom Layer w0.127: U5.4 15.89,11.65 16.19,11.95
$1N26702: length 4.4
  Bottom Layer w0.127: 16.19,13.35 16.23,13.35 16.95,12.63 16.95,11.52 16.59,11.15 U5.5
$1N26708: length 2.7
  Bottom Layer w0.127: U5.27 31.99,10.73 31.99,10.74 31.99,11.57 32.27,11.85 32.27,11.91 32.34,11.99
$1N26709: length 2.6
  Bottom Layer w0.127: 31.03,11.98 31.29,11.72 U5.26
$1N26733: length 2
  Top Layer w0.127: R61.1 39.76,35.52 LED9.3
$1N26734: length 1.9
  Top Layer w0.127: R60.2 44.19,38.35 LED9.4
$1N26735: length 1.7
  Top Layer w0.127: LED9.1 45.86,35.13 R59.2
$1N26741: length 1.9
  Top Layer w0.127: 12.41,40.52 11.11,40.52 10.88,40.29 SW3.6
$1N26742: length 3.7
  Top Layer w0.127: 8.9,42.02 9.38,42.51 12.41,42.51
$1N26747: length 3.7
  Top Layer w0.127: 4.79,34.38 4.79,34.71 3.64,35.85 3.64,36.76 4.23,37.35
$1N26748: length 3.6
  Top Layer w0.127: SW3.3 6.21,33.76 4.8,32.35 4.79,32.35
$1N26752: length 3.9
  Top Layer w0.127: SW3.2 4.92,36.36 4.86,36.31 4.86,35.19 5.47,34.58 5.47,34.03 4.8,33.36 4.79,33.36
$1N26784: length 3.8
  Top Layer w0.254: Q3.1 8.57,31.48 v1(8.57,31.43)
  Bottom Layer w0.127: v1(8.57,31.43) 8.06,30.92 v1(5.09,30.92)
$1N26789: length 1.6
  Top Layer w0.254: RLED.1 45.2,12.26 U6.1
$1N26818: length 7.5
  Top Layer w0.127: BUZZER1.1 3.82,28.21 7.68,32.06 7.68,32.73 8.34,33.4 Q3.2
$1N26823: length 1.7
  Top Layer w0.254: v1(30.31,60.79) LED10.1
  Bottom Layer w0.254: v1(30.31,60.79) 30.18,60.67 v1(28.66,60.67)

## Copper pours and planes (outline as drawn; the poured copper is in the pictures)
GND on Top Layer: 0.01,63.75 48.05,63.75 48.05,-0.01 0.01,-0.01
GND on Bottom Layer: 0.01,63.75 48.05,63.75 48.05,-0.01 0.01,-0.01

## Text on the board
Top Silkscreen Layer: 3V3 CLK DIO GND | OFF | ON | USB | BAT | BATTERY | MOTOR
